# Altium schematic sheet Full_components_doable_2026-10-19.schdoc
size 299 x 226 mm
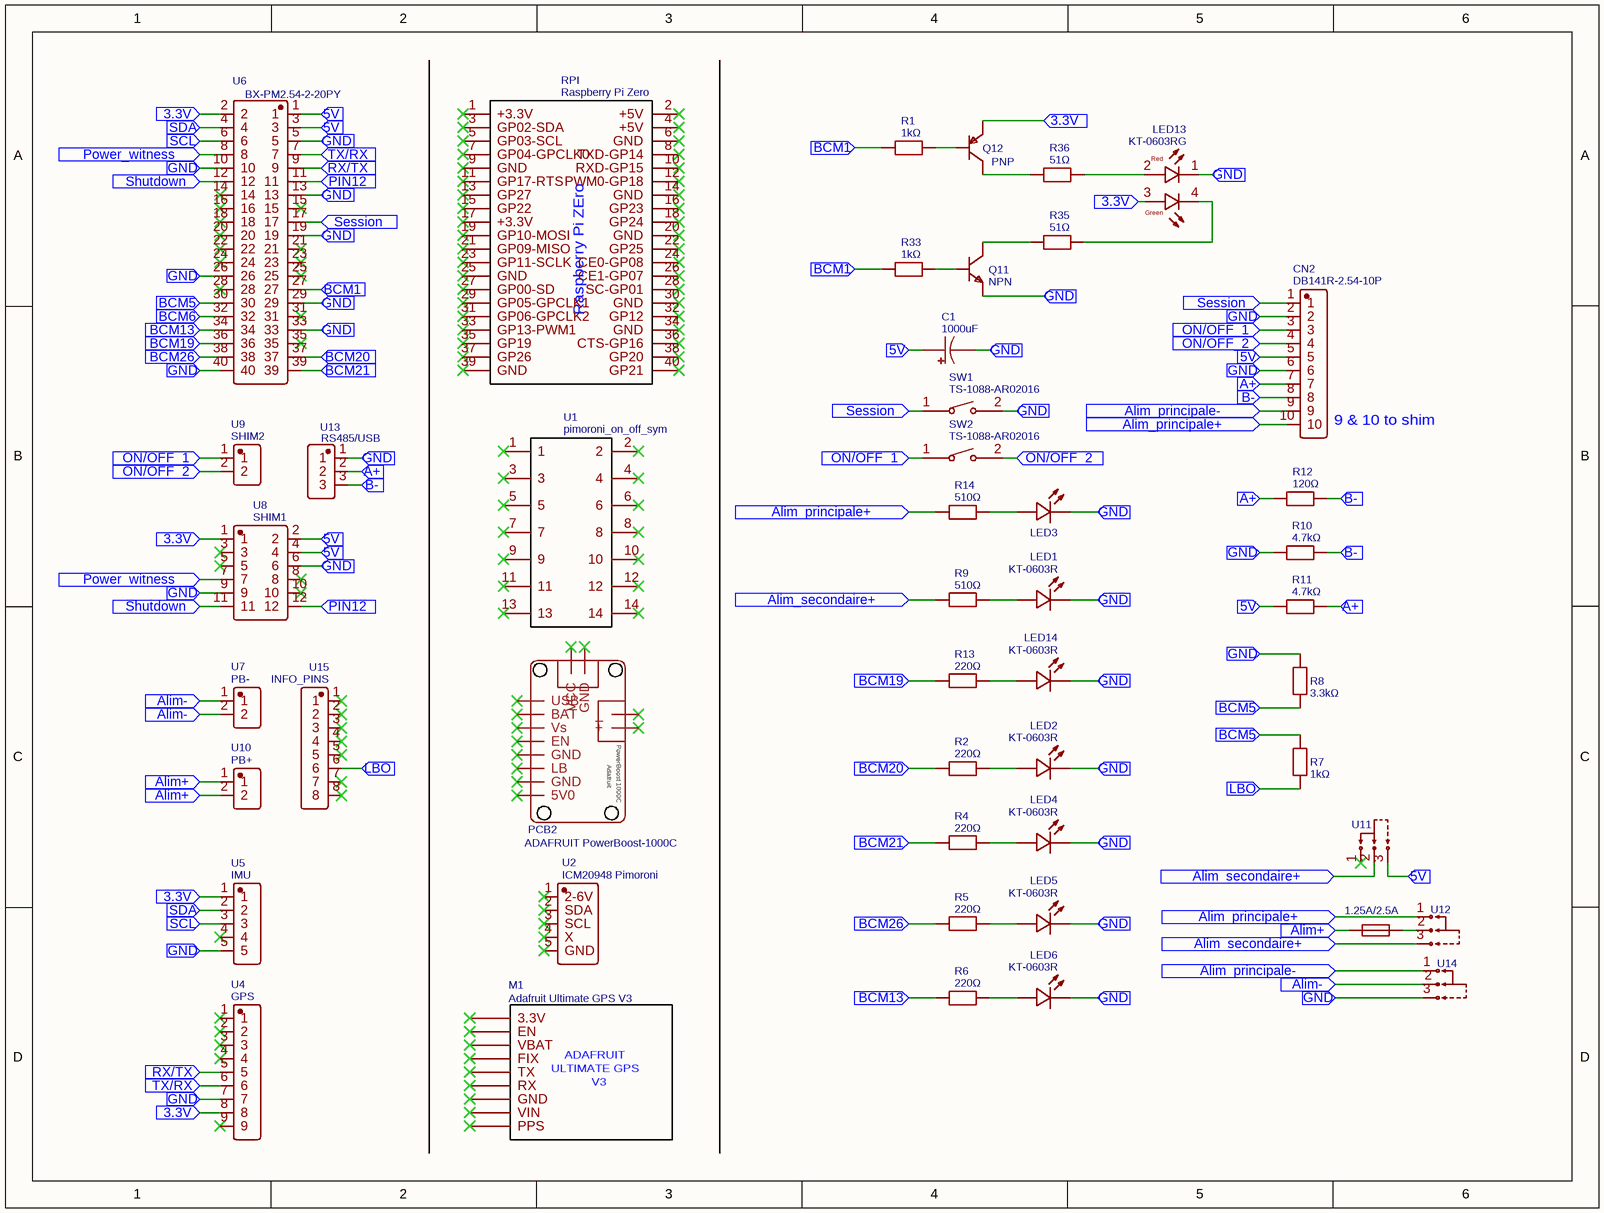
[diagram p0: Full_components_doable_2026-10-19.schdoc]

## Parts
C1  1000uF  [CAP-TH_BD8.0-P3.50-D0.6-FD]
CN2  DB141R-2.54-10P  [CONN-TH_10P-P2.54_DIBO_DB141R-2.54-10P]
F1  1.25A/2.5A  [F1812]
LED1  KT-0603R  [LED-SMD_L1.6-W0.8-R-RD]
LED2  KT-0603R  [LED-SMD_L1.6-W0.8-R-RD]
LED3  KT-0603R  [LED-SMD_L1.6-W0.8-R-RD]  (value not drawn)
LED4  KT-0603R  [LED-SMD_L1.6-W0.8-R-RD]
LED5  KT-0603R  [LED-SMD_L1.6-W0.8-R-RD]
LED6  KT-0603R  [LED-SMD_L1.6-W0.8-R-RD]
LED13  KT-0603RG  [LED-SMD_4P-L1.6-W1.5_KT-0603RG]
LED14  KT-0603R  [LED-SMD_L1.6-W0.8-R-RD]
M1  Adafruit Ultimate GPS V3  [ADAFRUIT ULTIMATE GPS BREAKOUT V3]
PCB2  ADAFRUIT PowerBoost-1000C  [POWERBOOST 1000C]
Q11  NPN  [TO-92-3_L4.8-W3.7-P1.27-R-1]
Q12  PNP  [TO-92-3_L4.9-W3.7-P1.27-L]
R1  1kΩ  [R0603]
R2  220Ω  [R0603]
R4  220Ω  [R0603]
R5  220Ω  [R0603]
R6  220Ω  [R0603]
R7  1kΩ  [R0603]
R8  3.3kΩ  [R0603]
R9  510Ω  [R0603]
R10  4.7kΩ  [R0603]
R11  4.7kΩ  [R0603]
R12  120Ω  [R0603]
R13  220Ω  [R0603]
R14  510Ω  [R0603]
R33  1kΩ  [R0603]
R35  51Ω  [R0603]
R36  51Ω  [R0603]
RPI  Raspberry Pi Zero  [RASPBERRY_PI_ZERO]
SW1  TS-1088-AR02016  [SW-SMD_L3.9-W3.0-P4.45]
SW2  TS-1088-AR02016  [SW-SMD_L3.9-W3.0-P4.45]
U1  pimoroni_on_off_sym  [PIMORONI_ON_OFF_SHIM]
U2  ICM20948 Pimoroni  [BME280_PIMORONI]
U4  GPS  [HDR-TH_9P-P2.54-V-F-4]
U5  IMU  [HDR-TH_5P-P2.54-V-F-B]
U6  BX-PM2.54-2-20PY  [HDR-TH_40P-P2.54-V-F-R2-C20-S2.54]
U7  PB-  [HDR-TH_2P-P2.54-V-F-1]
U8  SHIM1  [HDR-TH_12P-P2.54-V-F-R2-C6-S2.54]
U9  SHIM2  [HDR-TH_2P-P2.54-V-F-1]
U10  PB+  [HDR-TH_2P-P2.54-V-F-1]
U11  SS12D10G5  [SW-TH_SHOU-HAN_SS12D10G4]  (value not drawn)
U12  SS12D10G5  [SW-TH_SHOU-HAN_SS12D10G4]  (value not drawn)
U13  RS485/USB  [HDR-TH_3P-P2.54-V-F]
U14  SS12D10G5  [SW-TH_SHOU-HAN_SS12D10G4]  (value not drawn)
U15  INFO_PINS  [HDR-TH_8P-P2.54-V-F]

## Ports
3.3V (in), 5V (in), A+ (in), Alim+ (in), Alim- (in), Alim_principale+ (in), Alim_principale- (in), Alim_secondaire+ (in), B- (in), BCM1 (in), BCM5 (in), BCM6 (in), BCM13 (in), BCM19 (in), BCM20 (in), BCM21 (in), BCM26 (in), GND (in), LBO (in), ON/OFF_1 (in), ON/OFF_2 (in), PIN12 (in), Power_witness (in), RX/TX (in), SCL (in), SDA (in), Session (in), Shutdown (in), TX/RX (in)

## Nets
3.3V: LED13.3(A) Q12.3(E) U4.8 U5.1 U6.2 U8.1 ; port 3.3V
5V: C1.1 CN2.5 R11.1 U6.1 U6.3 U8.2 U8.4 U11.3 ; port 5V
A+: CN2.7 R11.2 R12.1 U13.2 ; port A+
Alim+: F1.2 U10.1 U10.2 ; port Alim+
Alim-: U7.1 U7.2 U14.2 ; port Alim-
Alim_principale+: CN2.10 R14.1 U12.1 ; port Alim_principale+
Alim_principale-: CN2.9 U14.1 ; port Alim_principale-
Alim_secondaire+: R9.1 U11.2 U12.3 ; port Alim_secondaire+
B-: CN2.8 R10.2 R12.2 U13.3 ; port B-
BCM1: R1.1 R33.1 U6.27 ; port BCM1
BCM5: R7.1 R8.2 U6.30 ; port BCM5
BCM6: U6.32 ; port BCM6
BCM13: R6.1 U6.34 ; port BCM13
BCM19: R13.1 U6.36 ; port BCM19
BCM20: R2.1 U6.37 ; port BCM20
BCM21: R4.1 U6.39 ; port BCM21
BCM26: R5.1 U6.38 ; port BCM26
GND: C1.2 CN2.2 CN2.6 LED1.2(K) LED2.2(K) LED3.2(K) LED4.2(K) LED5.2(K) LED6.2(K) LED13.1(C) LED14.2(K) Q11.3(E) R8.1 R10.1 SW1.2 U4.7 U5.5 U6.5 U6.10 U6.13 U6.19 U6.26 U6.29 U6.33 U6.40 U8.6 U8.9 U13.1 U14.3 ; port GND
LBO: R7.2 U15.6 ; port LBO
ON/OFF_1: CN2.3 SW2.1 U9.1 ; port ON/OFF_1
ON/OFF_2: CN2.4 SW2.2 U9.2 ; port ON/OFF_2
PIN12: U6.11 U8.12 ; port PIN12
Power_witness: U6.8 U8.7 ; port Power_witness
RX/TX: U4.5 U6.9 ; port RX/TX
SCL: U5.3 U6.6 ; port SCL
SDA: U5.2 U6.4 ; port SDA
Session: CN2.1 SW1.1 U6.17 ; port Session
Shutdown: U6.12 U8.11 ; port Shutdown
TX/RX: U4.6 U6.7 ; port TX/RX
NetF1_1: F1.1 U12.2
NetLED1_1: LED1.1(A) R9.2
NetLED2_1: LED2.1(A) R2.2
NetLED3_1: LED3.1(A) R14.2
NetLED4_1: LED4.1(A) R4.2
NetLED5_1: LED5.1(A) R5.2
NetLED6_1: LED6.1(A) R6.2
NetLED13_2: LED13.2(A) R36.2
NetLED13_4: LED13.4(C) R35.2
NetLED14_1: LED14.1(A) R13.2
NetQ11_1: Q11.1(C) R35.1
NetQ11_2: Q11.2(B) R33.2
NetQ12_1: Q12.1(C) R36.1
NetQ12_2: Q12.2(B) R1.2

Not connected (* = marked no-connect by the designer): M1 1(3.3V)* 2(EN)* 3(VBAT)* 4(FIX)* 5(TX)* 6(RX)* 7(GND)* 8(VIN)* 9(PPS)*; PCB2 1(USB)* 2(BAT)* 3(Vs)* 4(EN)* 5(GND)* 6(LB)* 7(GND)* 8(5V0)* 9(VCC)* 10(GND)*; RPI 1(+3.3V)* 2(+5V)* 3(GP02-SDA)* 4(+5V)* 5(GP03-SCL)* 6(GND)* 7(GP04-GPCLK0)* 8(TXD-GP14)* 9(GND)* 10(RXD-GP15)* 11(GP17-RTS)* 12(PWM0-GP18)* 13(GP27)* 14(GND)* 15(GP22)* 16(GP23)* 17(+3.3V)* 18(GP24)* 19(GP10-MOSI)* 20(GND)* 21(GP09-MISO)* 22(GP25)* 23(GP11-SCLK)* 24(CE0-GP08)* 25(GND)* 26(CE1-GP07)* 27(GP00-SD)* 28(SC-GP01)* 29(GP05-GPCLK1)* 30(GND)* 31(GP06-GPCLK2)* 32(GP12)* 33(GP13-PWM1)* 34(GND)* 35(GP19)* 36(CTS-GP16)* 37(GP26)* 38(GP20)* 39(GND)* 40(GP21)*; U1 1* 2* 3* 4* 5* 6* 7* 8* 9* 10* 11* 12* 13* 14*; U2 1(2-6V)* 2(SDA)* 3(SCL)* 4(X)* 5(GND)*; U4 1* 2* 3* 4* 9*; U5 4*; U6 14* 15* 16* 18* 20* 21* 22* 23* 24* 25* 28* 31* 35*; U8 3* 5* 8* 10*; U11 1*; U15 1* 2* 3* 4* 5* 7* 8*

## Notes on the sheet
- (near CN2) 9 & 10 to shim
- (in symbol ADAFRUIT PowerBoost-1000C) PowerBoost 1000C; Adafruit
- (in symbol Adafruit Ultimate GPS V3) ADAFRUIT; ULTIMATE GPS; V3
- (in symbol KT-0603RG) Red; Green
- (in symbol Raspberry Pi Zero) Raspberry Pi ZEro

## Library data of the parts
C1 = 1000uF: Manufacturer: MAN YUE(万裕科技); Manufacturer Part: ULR108M1AF1ACB; nameAlias: Value; Contributor: LCSC; Supplier: LCSC; Supplier Part: C248439; JLCPCB Part Class: Extended Part; spicePre: C; spiceSymbolName: ULR108M1AF1ACBX1CR
CN2 = DB141R-2.54-10P: Manufacturer: DORABO(地博电气); Manufacturer Part: DB141R-2.54-10P-GN; Contributor: LCSC; Supplier: LCSC; Supplier Part: C2898762; JLCPCB Part Class: Extended Part; spicePre: C; spiceSymbolName: DB141R-2.54-10P
F1 = 1.25A/2.5A: Manufacturer: Littelfuse(美国力特); Manufacturer Part: MINISMDC125F/16-2; Contributor: LCSC; Supplier: LCSC; Supplier Part: C15156; JLCPCB Part Class: Extended Part; spicePre: F; spiceSymbolName: MINISMDC125F/16-2
LED1-LED6 LED14 = KT-0603R: Manufacturer: KENTO; Supplier: LCSC; Manufacturer Part: KT-0603R; Supplier Part: C2286; JLCPCB Part Class: Basic Part; spicePre: L; spiceSymbolName: KT-0603R
LED13 = KT-0603RG: Manufacturer: KENTO; Manufacturer Part: KT-0603RYG; Supplier: LCSC; Supplier Part: C24477; JLCPCB Part Class: Extended Part; spicePre: L; spiceSymbolName: KT-0603RG
M1 = Adafruit Ultimate GPS V3: Contributor: alexisv; Supplier: Mouser; spicePre: M; spiceSymbolName: Adafruit_Ultimate_GPS_V3
PCB2 = ADAFRUIT PowerBoost-1000C: sourceId: QHlyZemsx; Mounted: No; Contributor: JamesBatten; timeStamp: 1463924090; spicePre: P; spiceSymbolName: ADAFRUIT PowerBoost-1000C
Q11 = NPN: Manufacturer: onsemi(安森美); Manufacturer Part: BC547BBU; Contributor: LCSC; Supplier: LCSC; Supplier Part: C896669; JLCPCB Part Class: Extended Part; spicePre: Q; spiceSymbolName: BC547BBU
Q12 = PNP: Manufacturer: LGE(鲁光); Manufacturer Part: BC557C; Contributor: LCSC; Supplier: LCSC; Supplier Part: C713618; JLCPCB Part Class: Extended Part; spicePre: Q; spiceSymbolName: BC557C
R1 R7 R33 = 1kΩ: Manufacturer: FOJAN(富捷); Manufacturer Part: FRC0603F1001TS; nameAlias: Value; Contributor: lcsc; Supplier: LCSC; Supplier Part: C2907002; JLCPCB Part Class: Extended Part; spicePre: R; spiceSymbolName: FRC0603F1001TS
R2 R4-R6 R13 = 220Ω: Manufacturer: FOJAN(富捷); Manufacturer Part: FRC0603F2200TS; nameAlias: Value; Contributor: lcsc; Supplier: LCSC; Supplier Part: C2907014; JLCPCB Part Class: Extended Part; spicePre: R; spiceSymbolName: FRC0603F2200TS
R8 = 3.3kΩ: Manufacturer: FOJAN(富捷); Manufacturer Part: FRC0603F3301TS; Contributor: lcsc; nameAlias: Value; Supplier: LCSC; Supplier Part: C2907023; JLCPCB Part Class: Extended Part; spicePre: R; spiceSymbolName: FRC0603F3301TS
R9 R14 = 510Ω: Manufacturer: FOJAN(富捷); Manufacturer Part: FRC0603F5100TS; nameAlias: Value; Contributor: lcsc; Supplier: LCSC; Supplier Part: C2907048; JLCPCB Part Class: Extended Part; spicePre: R; spiceSymbolName: FRC0603F5100TS
R10 R11 = 4.7kΩ: Manufacturer: FOJAN(富捷); Manufacturer Part: FRC0603F4701TS; nameAlias: Value; Contributor: LCSC; Supplier: LCSC; Supplier Part: C2907034; JLCPCB Part Class: Extended Part; spicePre: R; spiceSymbolName: FRC0603F4701TS
R12 = 120Ω: Manufacturer: FOJAN(富捷); Manufacturer Part: FRC0603F1200TS; nameAlias: Value; Contributor: lcsc; Supplier: LCSC; Supplier Part: C2906988; JLCPCB Part Class: Extended Part; spicePre: R; spiceSymbolName: FRC0603F1200TS
R35 R36 = 51Ω: Manufacturer: FOJAN(富捷); Manufacturer Part: FRC0603F51R0TS; nameAlias: Value; Contributor: LCSC; Supplier: LCSC; Supplier Part: C2907050; JLCPCB Part Class: Extended Part; spicePre: R; spiceSymbolName: FRC0603F51R0TS
RPI = Raspberry Pi Zero: Manufacturer Part: Raspberry Pi Zero WH; Manufacturer: Raspberry Pi Foundation; Contributor: mohsenmirzaie790; sourceId: XYSa4mEWQ; timeStamp: 1463799857; Supplier: Pollin; Supplier Part: 810885; link: https://www.pollin.de/p/raspberry-pi-zero-wh-mit-bestuecktem-header-810885; spicePre: R; spiceSymbolName: Raspberry Pi Zero
SW1 SW2 = TS-1088-AR02016: Manufacturer: XUNPU(讯普); Contributor: LCSC; Supplier: LCSC; Supplier Part: C720477; Manufacturer Part: TS-1088-AR02016; JLCPCB Part Class: Basic Part; spicePre: S; spiceSymbolName: TS-1088-AR02016
U1 = pimoroni_on_off_sym: Contributor: espenrog; spicePre: U; spiceSymbolName: pimoroni_on_off_sym
U2 = ICM20948 Pimoroni: Manufacturer: ReliaPro; Manufacturer Part: 2.54mm 1*5P Header; Contributor: axelvendeville.v2; Supplier Part: C50951; spicePre: U; spiceSymbolName: BME280_PIMORONI
U4 = GPS: Manufacturer: Bossie(博锡); Manufacturer Part: BX-PM2.54-1-9PY; Contributor: lcsc; Supplier: LCSC; Supplier Part: C49326044; JLCPCB Part Class: Extended Part; spicePre: U; spiceSymbolName: BX-PM2.54-1-9PY
U5 = IMU: Manufacturer: Bossie(博锡); Manufacturer Part: BX-PM2.54-1-5PY; Contributor: lcsc; Supplier: LCSC; Supplier Part: C18078128; JLCPCB Part Class: Extended Part; spicePre: U; spiceSymbolName: BX-PM2.54-1-5PY
U6 = BX-PM2.54-2-20PY: Manufacturer: Bossie(博锡); Contributor: lcsc; Supplier: LCSC; Supplier Part: C18078157; Manufacturer Part: BX-PM2.54-2-20PY; JLCPCB Part Class: Extended Part; spicePre: U; spiceSymbolName: BX-PM2.54-2-20PY
U7 = PB-: Manufacturer: Bossie(博锡); Manufacturer Part: BX-PM2.54-1-2PY; Contributor: lcsc; Supplier: LCSC; Supplier Part: C18078125; JLCPCB Part Class: Extended Part; spicePre: U; spiceSymbolName: BX-PM2.54-1-2PY
U8 = SHIM1: Manufacturer: Bossie(博锡); Manufacturer Part: BX-PM2.54-2-6PY; Contributor: lcsc; Supplier: LCSC; Supplier Part: C18078145; JLCPCB Part Class: Extended Part; spicePre: U; spiceSymbolName: BX-PM2.54-2-6PY
U9 = SHIM2: Manufacturer: Bossie(博锡); Manufacturer Part: BX-PM2.54-1-2PY; Contributor: lcsc; Supplier: LCSC; Supplier Part: C18078125; JLCPCB Part Class: Extended Part; spicePre: U; spiceSymbolName: BX-PM2.54-1-2PY
U10 = PB+: Manufacturer: Bossie(博锡); Manufacturer Part: BX-PM2.54-1-2PY; Contributor: lcsc; Supplier: LCSC; Supplier Part: C18078125; JLCPCB Part Class: Extended Part; spicePre: U; spiceSymbolName: BX-PM2.54-1-2PY
U11 U12 U14 = SS12D10G5: Manufacturer: SHOU HAN(首韩); Contributor: lcsc; Supplier: LCSC; Supplier Part: C7431054; Manufacturer Part: SS12D10G5; JLCPCB Part Class: Extended Part; spicePre: U; spiceSymbolName: SS12D10G5
U13 = RS485/USB: Manufacturer: Bossie(博锡); Manufacturer Part: BX-PM2.54-1-3PY; Contributor: lcsc; Supplier: LCSC; Supplier Part: C18078126; JLCPCB Part Class: Extended Part; spicePre: U; spiceSymbolName: BX-PM2.54-1-3PY
U15 = INFO_PINS: Manufacturer: Bossie(博锡); Manufacturer Part: BX-PM2.54-1-8PY; Contributor: lcsc; Supplier: LCSC; Supplier Part: C18078131; JLCPCB Part Class: Extended Part; spicePre: U; spiceSymbolName: BX-PM2.54-1-8PY